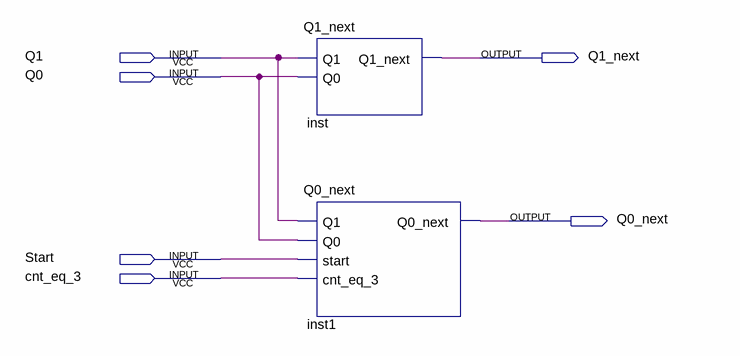
[diagram p0: schematic sheet]
// Quartus schematic next_state.bdf as structural Verilog: 2 symbols, 6 pins
module next_state (
  input  Q1,
  input  Q0,
  input  Start,
  input  cnt_eq_3,
  output Q1_next,
  output Q0_next
);

  Q1_next inst (.Q1(Q1), .Q0(Q0), .Q1_next(Q1_next));
  Q0_next inst1 (.Q1(Q1), .Q0(Q0), .start(Start), .cnt_eq_3(cnt_eq_3), .Q0_next(Q0_next));
endmodule
